# Altium schematic sheet Power-Sheet.SchDoc
size 420 x 297 mm; SheetNumber: 2; SheetTotal: 4
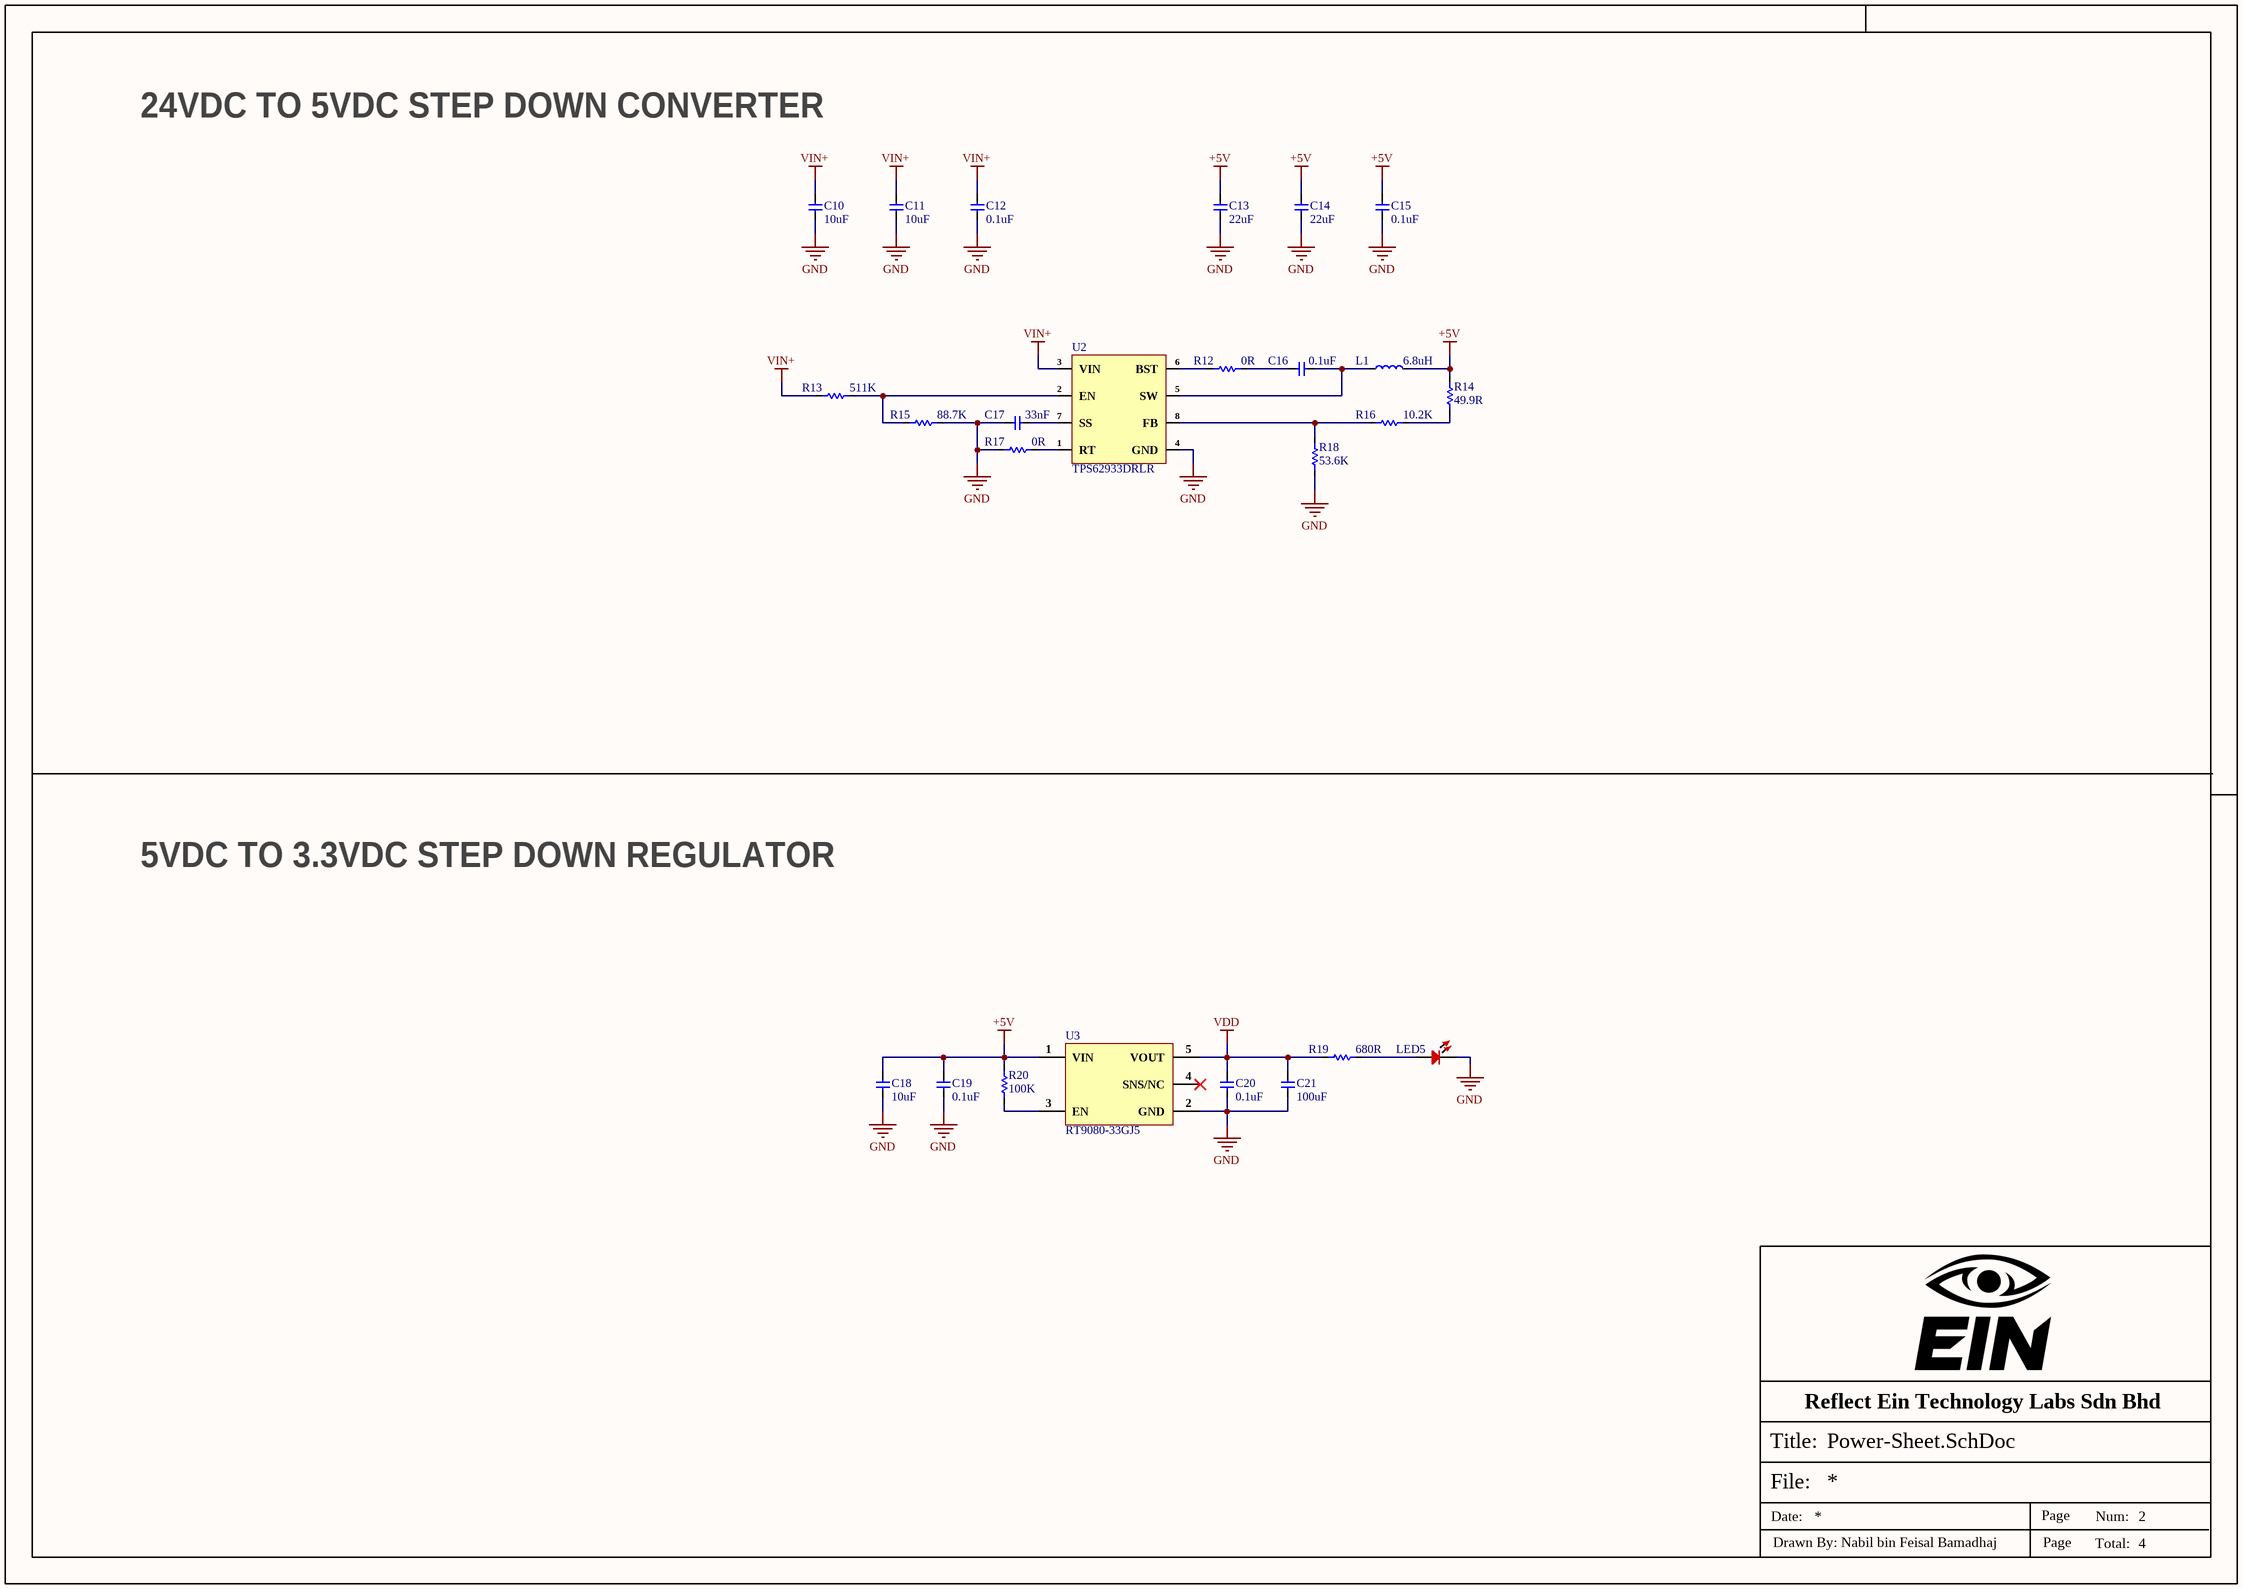
[diagram p0: Power-Sheet.SchDoc]

## Parts
C10  10uF  [Cap-1210]
C11  10uF  [Cap-1210]
C12  0.1uF  [Cap-0603]
C13  22uF  [Cap-0805]
C14  22uF  [Cap-0805]
C15  0.1uF  [Cap-0603]
C16  0.1uF  [Cap-0603]
C17  33nF  [Cap-0603]
C18  10uF  [Cap-0603]
C19  0.1uF  [Cap-0603]
C20  0.1uF  [Cap-0603]
C21  100uF  [Cap-1210]
L1  6.8uH  [ETQP3M6R8KVN]
LED5  RED  [LED-0603]  (value not drawn)
R12  0R  [Res-0603]
R13  511K  [Res-0603]
R14  49.9R  [Res-0603]
R15  88.7K  [Res-0603]
R16  10.2K  [Res-0603]
R17  0R  [Res-0603]
R18  53.6K  [Res-0603]
R19  680R  [Res-0603]
R20  100K  [Res-0603]
U2  TPS62933DRLR  [SOT-583]
U3  RT9080-33GJ5  [TSOT-23-5]

## Nets
+5V: C13.2 C14.2 C15.2 C18.2 C19.2 L1.2 R14.2 R20.2 U3.1(VIN)
GND: C10.1 C11.1 C12.1 C13.1 C14.1 C15.1 C17.1 C18.1 C19.1 C20.1 C21.1 LED5.2 R15.2 R17.1 R18.1 U2.4(GND) U3.2(GND)
VDD: C20.2 C21.2 R19.2 U3.5(VOUT)
VIN+: C10.2 C11.2 C12.2 R13.1 U2.3(VIN)
NetC16_1: C16.1 L1.1 U2.5(SW)
NetC16_2: C16.2 R12.2
NetC17_2: C17.2 U2.7(SS)
NetLED5_1: LED5.1 R19.1
NetR12_1: R12.1 U2.6(BST)
NetR13_2: R13.2 R15.1 U2.2(EN)
NetR14_1: R14.1 R16.2
NetR16_1: R16.1 R18.2 U2.8(FB)
NetR17_2: R17.2 U2.1(RT)
NetR20_1: R20.1 U3.3(EN)

Not connected (* = marked no-connect by the designer): U3 4(SNS/NC)*

## Notes on the sheet
- 24VDC TO 5VDC STEP DOWN CONVERTER
- 5VDC TO 3.3VDC STEP DOWN REGULATOR
- Reflect Ein Technology Labs Sdn Bhd
- File:
- Title:
- Date:
- Page
- Num:
- Total:
- Drawn By: Nabil bin Feisal Bamadhaj

## Library data of the parts
C10 C11 = GRM32ER71H106KA12L: CAP CER 10UF 50V X7R 1210; Manufacturer: Murata; Item Type: Capacitors; Supplier: Future Electronics; LCSC Part Number: C77102; Manufacturer Part Number: GRM32ER71H106KA12L; RoHS: Yes; Stock: 960000; Pricing: 1000=0.325, 2000=0.32, 3000=0.315, 4000=0.315, 5000=0.305 (USD); Lead Free: 5697LeadFree; RoHS Compliant: 5897YesNo; ComponentLink1URL: https://datasheet.ciiva.com/16497/product-16497010.pdf?src-supplier=Future+Electronics; ComponentLink1Description: https://datasheet.ciiva.com/16497/product-16497010.pdf?src-supplier=Future+Electronics; ComponentLink2URL: https://datasheet.ciiva.com/3777/4286grm32er71h106ka1223-3777306.pdf?src-supplier=Arrow+Electronics; ComponentLink2Description: https://datasheet.ciiva.com/3777/4286grm32er71h106ka1223-3777306.pdf?src-supplier=Arrow+Electronics; ComponentLink3URL: https://datasheet.ciiva.com/11789/0900766b80ef921d-11789081.pdf?src-supplier=Rs; ComponentLink3Description: https://datasheet.ciiva.com/11789/0900766b80ef921d-11789081.pdf?src-supplier=Rs; ComponentLink4URL: https://datasheet.ciiva.com/11607/c02e-11607596.pdf?src-supplier=Avnet; ComponentLink4Description: https://datasheet.ciiva.com/11607/c02e-11607596.pdf?src-supplier=Avnet; ComponentLink5URL: https://datasheet.ciiva.com/6270/partnumbering-e-01-6270167.pdf?src-supplier=Digikey; ComponentLink5Description: https://datasheet.ciiva.com/6270/partnumbering-e-01-6270167.pdf?src-supplier=Digikey; ComponentLink6URL: https://datasheet.ciiva.com/6270/partnumbering-e-01-6270168.pdf?src-supplier=Digikey; ComponentLink6Description: https://datasheet.ciiva.com/6270/partnumbering-e-01-6270168.pdf?src-supplier=Digikey; ComponentLink7URL: https://datasheet.ciiva.com/6270/partnumbering-e-01-6270169.pdf?src-supplier=Digikey; ComponentLink7Description: https://datasheet.ciiva.com/6270/partnumbering-e-01-6270169.pdf?src-supplier=Digikey; ComponentLink8URL: https://datasheet.ciiva.com/46441/1754714-46441340.pdf?src-supplier=Element14; ComponentLink8Description: https://datasheet.ciiva.com/46441/1754714-46441340.pdf?src-supplier=Element14
C12 C15 C16 C19 C20 = GCJ188R71H104KA12D: CAP CER 0.1UF 50V X7R 0603; Manufacturer: Murata; Item Type: Capacitors; Material: 4241ConductorMaterial; Value: 100nF; Tolerance: 10%; Supplier: Mouser; LCSC Part Number: C161115; Manufacturer Part Number: GCJ188R71H104KA12D; RoHS: Yes; Stock: 342536; Pricing: 1=0.13, 10=0.056, 50=0.056, 100=0.036, 1000=0.032, 10000=0.02 (USD); Mounting Technology: Surface Mount; Case/Package: 0603; Case Code (Metric): 1608; Case Code (Imperial): 0603; Min Operating Temperature: -55°C; Max Operating Temperature: 125°C; Dielectric: X7R; Package Quantity: 1; Voltage Rating: 50V; Packaging: Tape and Reel; Voltage Rating (DC): 50V; Termination: SMD/SMT; Features: Soft Termination; Series: GCJ; Construction: Flat; Length: 1.6mm; Width: 0.031inch; Height: 0.8mm; Thickness: 0.035inch; Depth: 0.8mm; Ratings: AEC-Q200; Radiation Hardening: No; RoHS Compliant: Yes; Lead Free: 5697LeadFree; ComponentLink1URL: https://datasheet.ciiva.com/135/product-135604.pdf?src-supplier=Digikey; ComponentLink1Description: https://datasheet.ciiva.com/135/product-135604.pdf?src-supplier=Digikey; ComponentLink2URL: https://datasheet.ciiva.com/26889/getdatasheetpartid-369886-26889118.pdf?src-supplier=Verical; ComponentLink2Description: https://datasheet.ciiva.com/26889/getdatasheetpartid-369886-26889118.pdf?src-supplier=Verical; ComponentLink3URL: https://datasheet.ciiva.com/135/s0717e-135605.pdf?src-supplier=Digikey; ComponentLink3Description: https://datasheet.ciiva.com/135/s0717e-135605.pdf?src-supplier=Digikey; ComponentLink4URL: https://datasheet.ciiva.com/135/s0717e-135606.pdf?src-supplier=Digikey; ComponentLink4Description: https://datasheet.ciiva.com/135/s0717e-135606.pdf?src-supplier=Digikey; ComponentLink5URL: https://datasheet.ciiva.com/16440/c03e-16440425.pdf?src-supplier=Future+Electronics; ComponentLink5Description: https://datasheet.ciiva.com/16440/c03e-16440425.pdf?src-supplier=Future+Electronics
C13 C14 = GRM21BZ71A226ME15L: CAP CER 22UF 10V X7R 0805; Manufacturer: Murata; Material: 4241ConductorMaterial; Tolerance: 20%; Item Type: Capacitor; Supplier: Digi-Key; Supplier Part Number: 490-GRM21BZ71A226ME15LCT-ND; Manufacturer Part Number: GRM21BZ71A226ME15L; RoHS: Yes; Category: Ceramic Capacitors; Stock: 49126; Pricing: 1=0.39, 10=0.259, 50=0.191, 100=0.1556, 500=0.12282, 1000=0.10372 (USD); Package: 0805; Min Operating Temperature: -55°C; Max Operating Temperature: 125°C; Value: 22uF; Voltage Rating: 10V; Length: 2mm; Width: 1.25mm; Height: 1.45mm; Thickness: 1.25mm; ComponentLink1URL: https://datasheet.octopart.com/GRM21BZ71A226ME15L-Murata-datasheet-165579666.pdf?src-supplier=TME; ComponentLink1Description: https://datasheet.octopart.com/GRM21BZ71A226ME15L-Murata-datasheet-165579666.pdf?src-supplier=TME; LCSC Part Number: C907991; ComponentLink2Description: LCSC; ComponentLink2URL: https://www.lcsc.com/product-detail/Multilayer-Ceramic-Capacitors-MLCC-SMD-SMT_Murata-Electronics-GRM21BZ71A226ME15L_C907991.html
C17 = GCJ188R71H333KA12D: CAP CER 0.033UF 50V X7R 0603; Manufacturer: Murata; Item Type: Capacitors; Tolerance: 10%; Supplier: Mouser; LCSC Part Number: C2173059; Manufacturer Part Number: GCJ188R71H333KA12D; RoHS: Yes; Stock: 15481; Pricing: 1=0.18, 10=0.072, 50=0.072, 100=0.047, 1000=0.039, 10000=0.027 (USD); Mounting Technology: Surface Mount; Case/Package: 0603; Case Code (Imperial): 0603; Case Code (Metric): 1608; Min Operating Temperature: -55°C; Max Operating Temperature: 125°C; Packaging: Tape and Reel; Value: 33nF; Package Quantity: 1; Voltage Rating: 50V; Dielectric: X7R; Voltage Rating (DC): 50V; Termination: SMD/SMT; Features: Soft Termination; Series: GCJ; Length: 1.6mm; Width: 0.031inch; Thickness: 0.031inch; Depth: 0.8mm; Ratings: AEC-Q200; Lead Free: Lead Free; RoHS Compliant: Yes; ComponentLink1URL: https://datasheet.ciiva.com/168/product-168891.pdf?src-supplier=Digikey; ComponentLink1Description: https://datasheet.ciiva.com/168/product-168891.pdf?src-supplier=Digikey; ComponentLink2URL: https://datasheet.ciiva.com/168/s0717e-168892.pdf?src-supplier=Digikey; ComponentLink2Description: https://datasheet.ciiva.com/168/s0717e-168892.pdf?src-supplier=Digikey; ComponentLink3URL: https://datasheet.ciiva.com/168/s0717e-168893.pdf?src-supplier=Digikey; ComponentLink3Description: https://datasheet.ciiva.com/168/s0717e-168893.pdf?src-supplier=Digikey
C18 = GRM188Z71A106KA73D: CAP CER 10UF 10V X7R 0603; Manufacturer: Murata; Item Type: Capacitor; Material: 4241ConductorMaterial; Tolerance: 10%; Supplier: Mouser; LCSC Part Number: C2959727; Manufacturer Part Number: GRM188Z71A106KA73D; RoHS: Yes; Stock: 390983; Pricing: 1=0.36, 10=0.155, 50=0.155, 100=0.104, 1000=0.094, 10000=0.065 (USD); Case/Package: 345Case; Min Operating Temperature: -55°C; Max Operating Temperature: 125°C; Value: 10uF; Voltage Rating: 10V; Length: 1.6mm; Width: 800um; Height: 1mm; Thickness: 800um; RoHS Compliant: Yes; ComponentLink1URL: https://datasheet.octopart.com/GRM188Z71A106KA73D-Murata-datasheet-165579666.pdf?src-supplier=TME; ComponentLink1Description: https://datasheet.octopart.com/GRM188Z71A106KA73D-Murata-datasheet-165579666.pdf?src-supplier=TME
C21 = CC1210MKX5R5BB107: CAP CER 100UF 6.3V X5R 1210; Manufacturer: Yageo; Item Type: Capacitors; Tolerance: 20%; Supplier: Future Electronics; LCSC Part Number: C326605; Manufacturer Part Number: CC1210MKX5R5BB107; RoHS: Yes; Stock: 155500; Pricing: 500=0.199, 1500=0.195, 2000=0.193, 5000=0.19, 7500=0.187 (USD); Mounting Technology: Surface Mount; Case/Package: 1210; Case Code (Imperial): 1210; Case Code (Metric): 3225; Weight: 0.000564oz; Min Operating Temperature: -55°C; Max Operating Temperature: 85°C; Value: 100uF; Packaging: Tape and Reel; Voltage Rating: 6.3V; Voltage Rating (DC): 6.3V; Dielectric: X5R; Termination: SMD/SMT; Series: CC; Length: 3.2mm; Width: 0.098inch; Height: 2.5mm; Thickness: 0.11inch; Depth: 2.5mm; Radiation Hardening: No; Lead Free: Lead Free; Halogen Free: Halogen Free; RoHS Compliant: Yes; ComponentLink1URL: http://www.mouser.com/ds/2/447/Yageo_UPY-GP_NP0_16V-to-50V_9-358835.pdf?src-supplier=Mouser; ComponentLink1Description: http://www.mouser.com/ds/2/447/Yageo_UPY-GP_NP0_16V-to-50V_9-358835.pdf?src-supplier=Mouser; ComponentLink2URL: https://www.verical.com/server-webapp/html/getDatasheet?partID=557130&src-supplier=Verical; ComponentLink2Description: https://www.verical.com/server-webapp/html/getDatasheet?partID=557130&src-supplier=Verical; ComponentLink3URL: http://www.yageo.com/documents/recent/UPY-GPHC_X5R_4V-to-50V_25.pdf?src-supplier=Digikey; ComponentLink3Description: http://www.yageo.com/documents/recent/UPY-GPHC_X5R_4V-to-50V_25.pdf?src-supplier=Digikey; ComponentLink4URL: http://www.yageo.com/documents/recent/UPY-GPHC_X5R_4V-to-50V_12.pdf?src-supplier=Avnet; ComponentLink4Description: http://www.yageo.com/documents/recent/UPY-GPHC_X5R_4V-to-50V_12.pdf?src-supplier=Avnet
L1 = ETQ-P3M6R8KVN: FIXED IND 6.8UH 4.5A 50.16 MOHM; Manufacturer: Panasonic; Item Type: Inductors; Value: 45.6mR; Supplier: Mouser; LCSC Part Number: C412310; Manufacturer Part Number: ETQ-P3M6R8KVN; RoHS: Yes; Stock: 4626; Pricing: 1=0.84, 10=0.609, 50=0.609, 100=0.502, 1000=0.405, 10000=0.344 (USD); ComponentLink1URL: http://www.farnell.com/datasheets/2820815.pdf?src-supplier=Farnell; ComponentLink1Description: http://www.farnell.com/datasheets/2820815.pdf?src-supplier=Farnell; ComponentLink2URL: https://industrial.panasonic.com/cdbs/www-data/pdf/AGL0000/AGL0000C63.pdf?src-supplier=Digikey; ComponentLink2Description: https://industrial.panasonic.com/cdbs/www-data/pdf/AGL0000/AGL0000C63.pdf?src-supplier=Digikey; ComponentLink3URL: https://datasheet.octopart.com/ETQ-P3M6R8KVN-Panasonic-datasheet-136412728.pdf?src-supplier=Element14; ComponentLink3Description: https://datasheet.octopart.com/ETQ-P3M6R8KVN-Panasonic-datasheet-136412728.pdf?src-supplier=Element14
LED5 = NCD0603R3: RED LED 0603 Light Emitting Diodes; Manufacturer: Foshan NationStar Optoelectronics; Manufacturer Part Number: NCD0603R3; Package: 0603; Item Type: LED; LCSC Part Number: C3151730; ComponentLink1Description: LCSC; ComponentLink1URL: https://www.lcsc.com/product-detail/Light-Emitting-Diodes-LED_Foshan-NationStar-Optoelectronics-NCD0603R3_C3151730.html
R12 R17 = RC0603FR-070RL: RES SMD 0R, 1%, 0.1W, 0603; Manufacturer: Yageo; Item Type: Resistor; Manufacturer Part Number: RC0603FR-070RL; Package: 0603; LCSC Part Number: C100044; ComponentLink9Description: LCSC; ComponentLink9URL: https://www.lcsc.com/product-detail/Chip-Resistor-Surface-Mount_YAGEO-RC0603FR-070RL_C100044.html
R13 = RT0603BRD07511KL: RES SMD 511K OHM 0.1% 1/10W 0603; Manufacturer: Yageo; Item Type: Resistors; Value: 511kR; Power Rating: 100mW; Voltage Rating: 75V; Temperature Coefficient: 25ppm/°C; Supplier: Future Electronics; LCSC Part Number: C861454; Manufacturer Part Number: RT0603BRD07511KL; RoHS: Yes; Stock: 35000; Pricing: 5000=0.0176, 15000=0.0172, 20000=0.0171, 50000=0.0167, 75000=0.0164 (USD); Case/Package: 0603; Case Code (Imperial): 0603; Case Code (Metric): 1608; Weight: 7.1E-05oz; Min Operating Temperature: -55°C; Max Operating Temperature: 155°C; Packaging: Tape and Reel; Tolerance: 0.1%; Number of Terminations: 2; Termination: SMD/SMT; Max Power Dissipation: 100mW; Features: Moisture Resistant; Series: RT; Length: 0.063inch; Width: 0.8mm; Height: 0.022inch; RoHS Compliant: Yes; ComponentLink1URL: https://datasheet.ciiva.com/12810/pyu-rt-1-to-0-05-rohs-l-4-12810871.pdf?src-supplier=Mouser; ComponentLink1Description: https://datasheet.ciiva.com/12810/pyu-rt-1-to-0-05-rohs-l-4-12810871.pdf?src-supplier=Mouser
R14 = RC0603FR-0749R9L: RES 49.9 OHM 1% 1/10W 0603; Manufacturer: Yageo; Temperature Coefficient: 100ppm/°C; Voltage Rating (DC): 50V; Power Rating: 100mW; Item Type: Resistor; Supplier 1: Arrow Electronics; Manufacturer Part Number: RC0603FR-0749R9L; RoHS: Yes; Category: Chip SMD Resistors; Stock 1: 2075000; Pricing 1: 5000=0.00280 (USD); Case/Package: 0603; Number of Pins: 2; Case Code (Imperial): 0603; Case Code (Metric): 1608; Size Code: 0603; Min Operating Temperature: -55°C; Max Operating Temperature: 155°C; Tolerance: 1%; Resistance: 49.9R; Resistor Type: Thick Film; Packaging: Tape and Reel; Voltage Rating: 50V; Termination: SMD/SMT; Features: Moisture Resistant; Series: RC; Max Power Dissipation: 100mW; Number of Terminations: 2; Construction: Rectangular; Resistance Tolerance: 1%; Technology: THICK FILM; Length: 1.6mm; Height: 0.45mm; Depth: 0.8mm; Lead Free: Lead Free; REACH SVHC: No SVHC; Military Standard: Not; RoHS Compliant: Yes; ComponentLink1URL: https://datasheet.ciiva.com/11808/0900766b80f96399-11808223.pdf?src-supplier=RSComponents; ComponentLink1Description: https://datasheet.ciiva.com/11808/0900766b80f96399-11808223.pdf?src-supplier=RSComponents; ComponentLink2URL: https://datasheet.ciiva.com/22747/443971-22747527.pdf?src-supplier=Element14; ComponentLink2Description: https://datasheet.ciiva.com/22747/443971-22747527.pdf?src-supplier=Element14; ComponentLink3URL: https://datasheet.ciiva.com/15189/getdatasheetpartid-325421-15189750.pdf?src-supplier=Verical; ComponentLink3Description: https://datasheet.ciiva.com/15189/getdatasheetpartid-325421-15189750.pdf?src-supplier=Verical; Supplier Part Number 1: RC0603FR-0749R9L; LCSC Part Number: C114625
R15 = RT0603BRD0788K7L: RES SMD 88.7KOHM 0.1% 1/10W 0603; Manufacturer: Yageo; Item Type: Resistors; Power Rating: 100mW; Value: 88.7kR; Voltage Rating: 75V; Temperature Coefficient: 25ppm/°C; Voltage Rating (DC): 50V; Supplier: Future Electronics; LCSC Part Number: C728599; Manufacturer Part Number: RT0603BRD0788K7L; RoHS: Yes; Stock: 5000; Pricing: 5000=0.0186, 15000=0.0181, 20000=0.018, 50000=0.0177, 75000=0.0173 (USD); Case/Package: 0603; Case Code (Metric): 1608; Case Code (Imperial): 0603; Min Operating Temperature: -55°C; Max Operating Temperature: 155°C; Packaging: Tape and Reel; Tolerance: 0.1%; Number of Terminations: 2; Termination: SMD/SMT; Max Power Dissipation: 100mW; Series: RT; RoHS Compliant: Yes; Lead Free: 5697LeadFree; ComponentLink1URL: https://datasheet.ciiva.com/12702/pyu-rt-1-to-0-05-rohs-l-4-12702687.pdf?src-supplier=Mouser; ComponentLink1Description: https://datasheet.ciiva.com/12702/pyu-rt-1-to-0-05-rohs-l-4-12702687.pdf?src-supplier=Mouser
R16 = RT0603BRE0710K2L: RES SMD 10.2KOHM 0.1% 1/10W 0603; Manufacturer: Yageo; Item Type: Resistors; Supplier: Digikey; LCSC Part Number: C705802; Manufacturer Part Number: RT0603BRE0710K2L; RoHS: Yes; Stock: 23436; Pricing: 1=0.14, 10=0.106, 50=0.0826, 100=0.0734, 500=0.0561, 1000=0.04998 (USD); ComponentLink1URL: https://datasheet.ciiva.com/2584/pyu-rt-1-to-0-05-rohs-l-5-2584166.pdf?src-supplier=Digikey; ComponentLink1Description: https://datasheet.ciiva.com/2584/pyu-rt-1-to-0-05-rohs-l-5-2584166.pdf?src-supplier=Digikey
R18 = RT0603BRD0753K6L: RES SMD 53.6KOHM 0.1% 1/10W 0603; Manufacturer: Yageo; Item Type: Resistors; Value: 53.6kR; Power Rating: 100mW; Voltage Rating: 75V; Temperature Coefficient: 25ppm/°C; Voltage Rating (DC): 50V; Supplier: Digikey; LCSC Part Number: C861467; Manufacturer Part Number: RT0603BRD0753K6L; RoHS: Yes; Stock: 7280; Pricing: 1=0.12, 10=0.094, 50=0.0846, 100=0.0755, 500=0.05202, 1000=0.04794 (USD); Case/Package: 0603; Case Code (Imperial): 0603; Case Code (Metric): 1608; Weight: 7.1E-05oz; Min Operating Temperature: -55°C; Max Operating Temperature: 155°C; Packaging: Tape and Reel; Tolerance: 0.1%; Package Quantity: 5000; Termination: SMD/SMT; Number of Terminations: 2; Max Power Dissipation: 100mW; Series: RT; Length: 0.063inch; Width: 0.8mm; Height: 0.022inch; Lead Free: Lead Free; RoHS Compliant: Yes; ComponentLink1URL: https://datasheet.ciiva.com/12799/pyu-rt-1-to-0-05-rohs-l-4-12799848.pdf?src-supplier=Mouser; ComponentLink1Description: https://datasheet.ciiva.com/12799/pyu-rt-1-to-0-05-rohs-l-4-12799848.pdf?src-supplier=Mouser; ComponentLink2URL: https://datasheet.ciiva.com/46635/pyu-rt-1-to-0-05-rohs-l-5-46635002.pdf?src-supplier=Digikey; ComponentLink2Description: https://datasheet.ciiva.com/46635/pyu-rt-1-to-0-05-rohs-l-5-46635002.pdf?src-supplier=Digikey; ComponentLink3URL: https://datasheet.ciiva.com/2585/pyu-rt-1-to-0-05-rohs-l-4-2585995.pdf?src-supplier=Digikey; ComponentLink3Description: https://datasheet.ciiva.com/2585/pyu-rt-1-to-0-05-rohs-l-4-2585995.pdf?src-supplier=Digikey
R19 = RC0603FR-07680RL: RES SMD 680 OHM 1% 1/10W 0603; Manufacturer: Yageo; Item Type: Resistor; Manufacturer Part Number: RC0603FR-07680RL; Package: 0603; ComponentLink4URL: https://www.lcsc.com/product-detail/Chip-Resistor-Surface-Mount_YAGEO-RC0603FR-07680RL_C112310.html; ComponentLink4Description: LCSC; LCSC Part Number: C112310
R20 = RC0603FR-07100KL: RES 100K OHM 1% 1/10W 0603; Manufacturer: Yageo; Item Type: Resistors; Value: 100kR; Temperature Coefficient: 100ppm/°C; Voltage Rating (DC): 50V; Power Rating: 100mW; Supplier: Rs; LCSC Part Number: C14675; Manufacturer Part Number: RC0603FR-07100KL; RoHS: Yes; Stock: 27300; Case/Package: 0603; Pins: 2; Case Code (Imperial): 0603; Case Code (Metric): 1608; Min Operating Temperature: -55°C; Max Operating Temperature: 155°C; Tolerance: 1%; Resistor Type: Thick Film; Packaging: Tape and Reel; Voltage Rating: 50V; Termination: SMD/SMT; Number of Terminations: 2; Features: Moisture Resistant; Series: RC; Max Power Dissipation: 100mW; Resistance Tolerance: 1%; Construction: Rectangular; Technology: THICK FILM; Length: 1.6mm; Width: 0.8mm; Height: 0.45mm; Depth: 0.8mm; Reach SVHC Compliant: No; Lead Free: 5697LeadFree; Military Standard: Not; RoHS Compliant: Yes; Supplier Part Number: 2424020; Category: Chip SMD Resistors; Mounting Technology: Surface Mount; Weight: 7.1E-05oz; Package Quantity: 5000; ComponentLink1URL: https://datasheet.ciiva.com/11819/0900766b80f96399-11819227.pdf?src-supplier=Rs; ComponentLink1Description: https://datasheet.ciiva.com/11819/0900766b80f96399-11819227.pdf?src-supplier=Rs; ComponentLink2URL: https://datasheet.ciiva.com/2455/pyu-r-int-thick-7-2455183.pdf?src-supplier=Digikey; ComponentLink2Description: https://datasheet.ciiva.com/2455/pyu-r-int-thick-7-2455183.pdf?src-supplier=Digikey; ComponentLink3URL: https://datasheet.ciiva.com/2455/pyu-r-int-thick-7-2455184.pdf?src-supplier=Digikey; ComponentLink3Description: https://datasheet.ciiva.com/2455/pyu-r-int-thick-7-2455184.pdf?src-supplier=Digikey; ComponentLink4URL: https://datasheet.ciiva.com/2455/pyu-r-int-thick-7-2455182.pdf?src-supplier=Digikey; ComponentLink4Description: https://datasheet.ciiva.com/2455/pyu-r-int-thick-7-2455182.pdf?src-supplier=Digikey
U2 = TPS62933DRLR: IC REG BUCK ADJ 3A SOT583; Manufacturer: Texas Instruments; Supplier: Mouser; Supplier Part Number: 595-TPS62933DRLR; Manufacturer Part Number: TPS62933DRLR; RoHS: No; Category: Voltage Regulators - Switching; Stock: 5259; Pricing: 1=0.7, 10=0.581, 50=0.581, 100=0.44, 1000=0.297, 10000=0.241 (USD); LCSC Part Number: C3200405; Item Type: IC
U3 = RT9080-33GJ5: TSOT-23-5 Linear Voltage Regulators (LDO) ROHS; Manufacturer: Richtek Tech; Item Type: IC; Manufacturer Part Number: RT9080-33GJ5; Package: TSOT-23-5; LCSC Part Number: C841192; ComponentLink1Description: LCSC; ComponentLink1URL: https://www.lcsc.com/product-detail/Linear-Voltage-Regulators-LDO_Richtek-Tech-RT9080-33GJ5_C841192.html